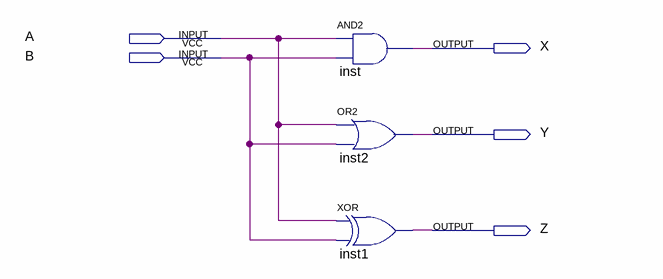
[diagram p0: schematic sheet]
// Quartus schematic Cap2ex1.bdf as structural Verilog: 3 symbols, 5 pins
module Cap2ex1 (
  input  A,
  input  B,
  output X,
  output Y,
  output Z
);

  and inst (X, A, B);
  or inst2 (Y, A, B);
  xor inst1 (Z, A, B);
endmodule
